# Altium project Microcontroller.PrjPcb
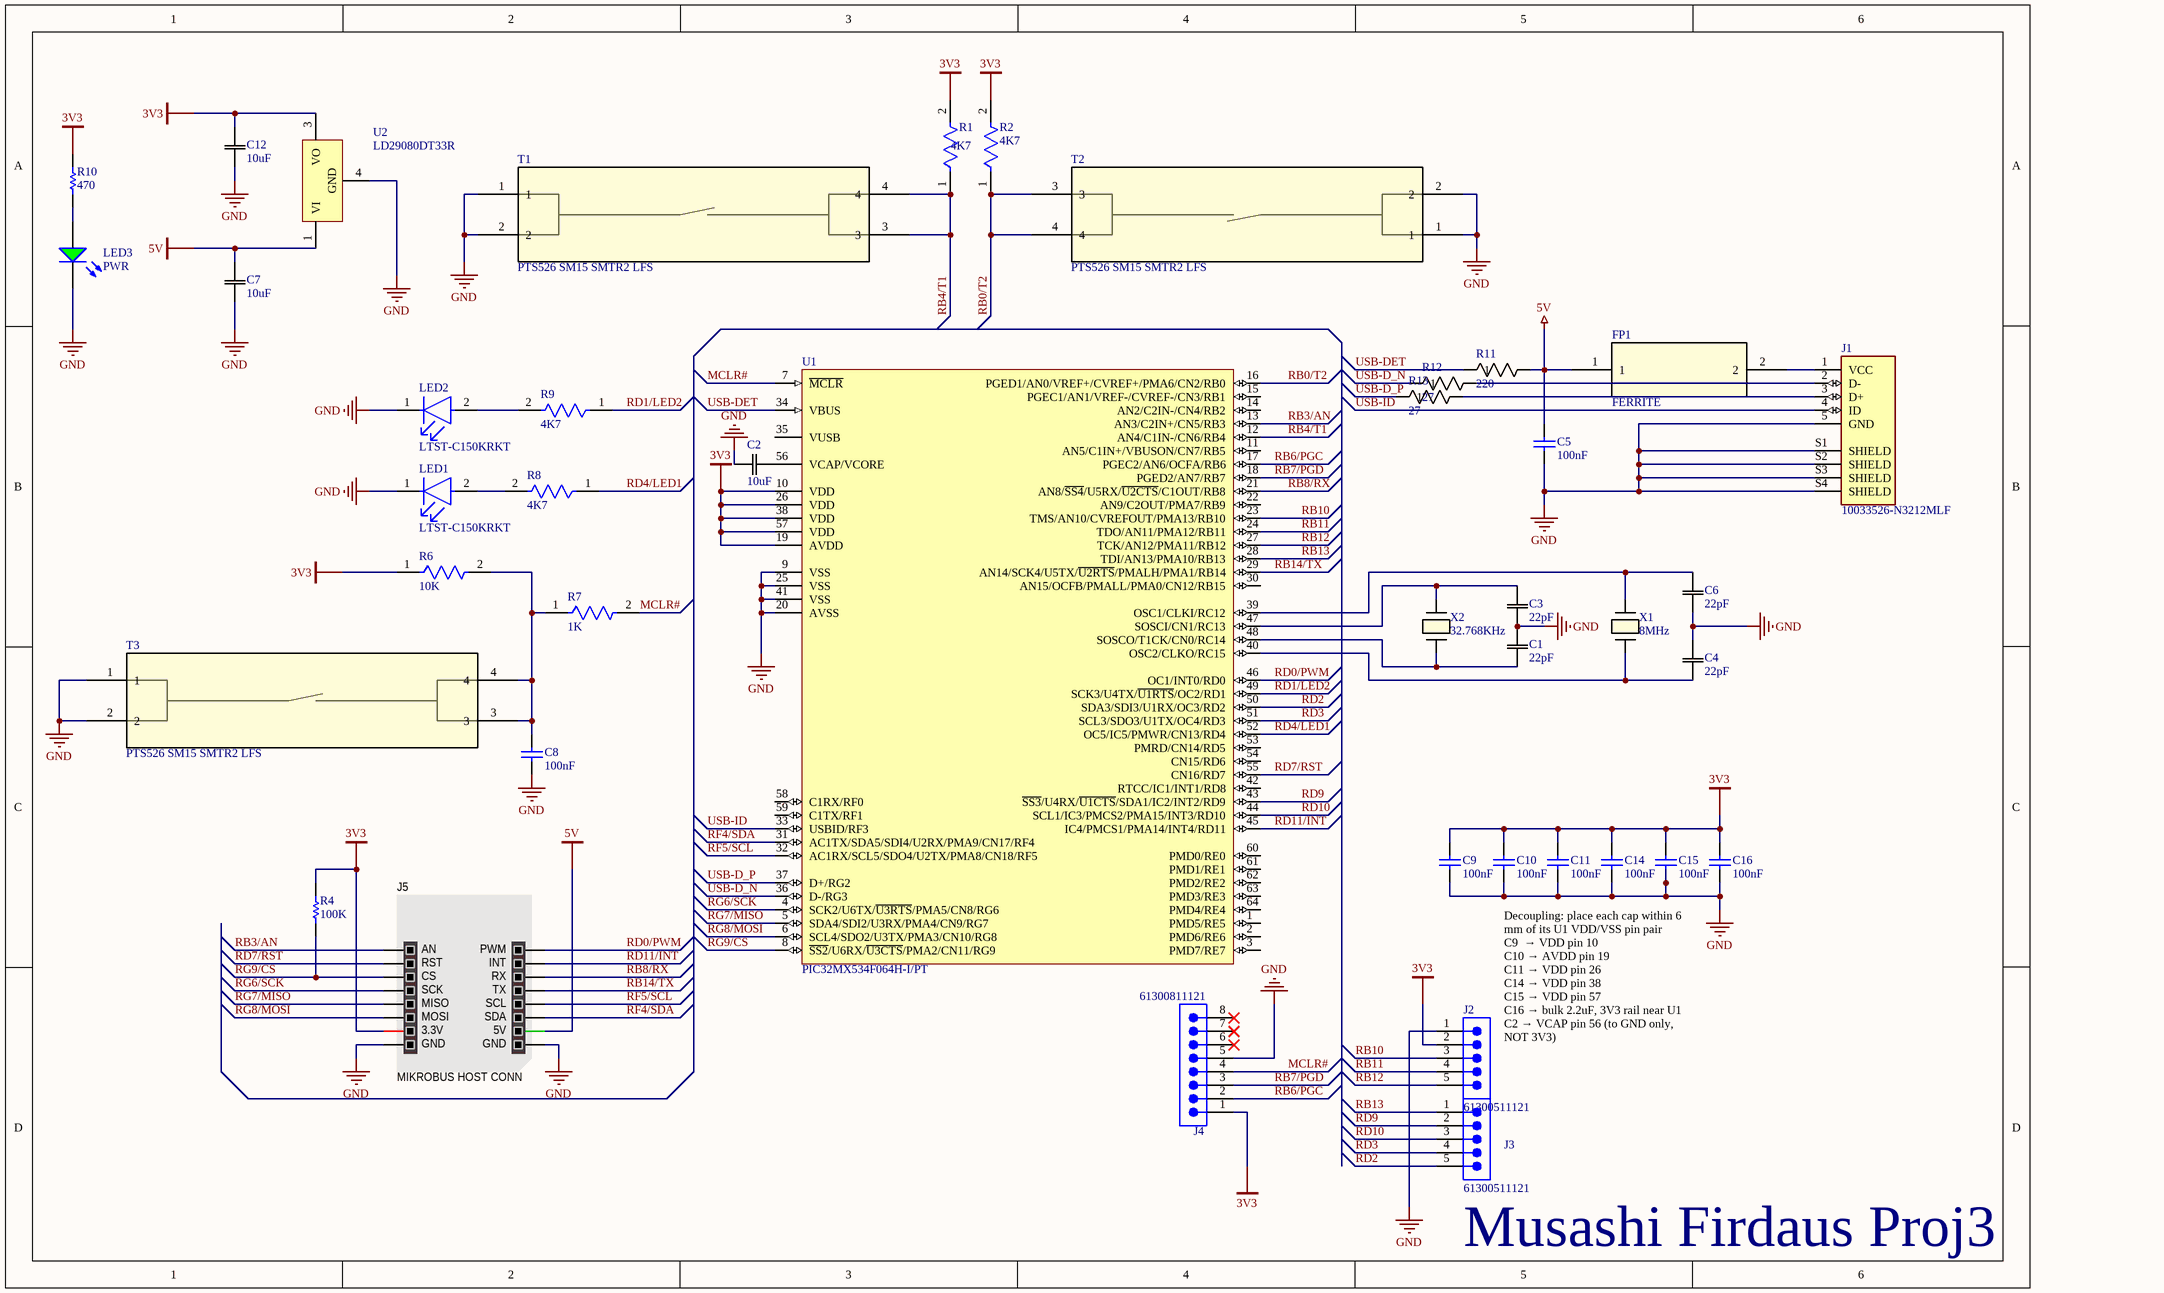
[diagram p0: Microcontroller.SchDoc]
1 sheet, 42 parts. Net scope: global (net labels, ports and power ports of the same name join across sheets).
Board file: Microcontroller.PcbDoc

## Sheet Microcontroller.SchDoc
size 381 x 241 mm; SheetNumber: 1; SheetTotal: 1

### Parts
C1  22pF  [CAP_CL31_SAM]
C2  10uF  [CAP_CL31_SAM]
C3  22pF  [CAP_CL31_SAM]
C4  22pF  [CAP_CL31_SAM]
C5  100nF  [KEMT-1206-2_M]
C6  22pF  [CAP_CL31_SAM]
C7  10uF  [CAP_CL31_SAM]
C8  100nF  [KEMT-1206-2_M]
C9  100nF  [KEMT-1206-2_M]
C10  100nF  [KEMT-1206-2_M]
C11  100nF  [KEMT-1206-2_M]
C12  10uF  [CAP_CL31_SAM]
C14  100nF  [KEMT-1206-2_M]
C15  100nF  [KEMT-1206-2_M]
C16  100nF  [KEMT-1206-2_M]
FP1  FERRITE  [HI1206P121R-10_LRD]
J1  10033526-N3212MLF  [AMPHENOL_10033526-N3212MLF]
J2  61300511121  [61300511121]
J3  61300511121  [61300511121]
J4  61300811121  [61300811121]
J5  MIKROBUS HOST CONN  [MIKROBUS HOST CONN 8gen TH]
LED1  LTST-C150KRKT  [FP-LTST-C150KRKT-MFG]
LED2  LTST-C150KRKT  [FP-LTST-C150KRKT-MFG]
LED3  PWR  [LTST-C230KGKT_V]
R1  4K7  [FP-RMCF1206-IPC_A]
R2  4K7  [FP-RMCF1206-IPC_A]
R4  100K  [RESC3116X65X40ML10T20]
R6  10K  [FP-RMCF1206-IPC_B]
R7  1K  [FP-RNCP1206-MFG]
R8  4K7  [FP-RMCF1206-IPC_A]
R9  4K7  [FP-RMCF1206-IPC_A]
R10  470  [RESC1206(3216)_N]
R11  220  [STA_RMCF1206_STP]
R12  27  [STA_RMCF1206_STP]
R13  27  [STA_RMCF1206_STP]
T1  PTS526 SM15 SMTR2 LFS  [SON4_PTS526 SM15 SMTR2 LFS_CNK]
T2  PTS526 SM15 SMTR2 LFS  [SON4_PTS526 SM15 SMTR2 LFS_CNK]
T3  PTS526 SM15 SMTR2 LFS  [SON4_PTS526 SM15 SMTR2 LFS_CNK]
U1  PIC32MX534F064H-I/PT  [TQFP-PT64_L]
U2  LD29080DT33R  [TO-252_N]
X1  8MHz  [XTAL_FC-135_EPS]
X2  32.768KHz  [XTAL_FC-135_EPS]

### Nets
3V3: C9.1 C10.1 C11.1 C12.2 C14.1 C15.1 C16.1 J2.2 J4.1 J5.7(3.3V) R1.2 R2.2 R4.2 R6.1 R10.2 U1.10(VDD) U1.19(AVDD) U1.26(VDD) U1.38(VDD) U1.57(VDD) U2.3(VO)
5V: C5.2 C7.2 FP1.1 J5.10(5V) R11.2 U2.1(VI)
GND: C1.2 C2.1 C3.1 C4.2 C5.1 C6.1 C7.1 C8.1 C9.2 C10.2 C11.2 C12.1 C14.2 C15.2 C16.2 J1.5(GND) J1.S1(SHIELD) J1.S2(SHIELD) J1.S3(SHIELD) J1.S4(SHIELD) J2.1 J4.5 J5.8(GND) J5.9(GND) LED1.1(C) LED2.1(C) LED3.2(K) T1.1 T1.2 T2.1 T2.2 T3.1 T3.2 U1.9(VSS) U1.20(AVSS) U1.25(VSS) U1.41(VSS) U2.4(GND)
MCLR#: J4.4 R7.2 U1.7(~{MCLR})
RB0/T2: R2.1 T2.3 T2.4 U1.16(PGED1/AN0/VREF+/CVREF+/PMA6/CN2/RB0)
RB3/AN: J5.1(AN) U1.13(AN3/C2IN+/CN5/RB3)
RB4/T1: R1.1 T1.3 T1.4 U1.12(AN4/C1IN-/CN6/RB4)
RB6/PGC: J4.2 U1.17(PGEC2/AN6/OCFA/RB6)
RB7/PGD: J4.3 U1.18(PGED2/AN7/RB7)
RB8/RX: J5.14(RX) U1.21(AN8/~{SS4}/U5RX/~{U2CTS}/C1OUT/RB8)
RB10: J2.3 U1.23(TMS/AN10/CVREFOUT/PMA13/RB10)
RB11: J2.4 U1.24(TDO/AN11/PMA12/RB11)
RB12: J2.5 U1.27(TCK/AN12/PMA11/RB12)
RB13: J3.1 U1.28(TDI/AN13/PMA10/RB13)
RB14/TX: J5.13(TX) U1.29(AN14/SCK4/U5TX/~{U2RTS}/PMALH/PMA1/RB14)
RD0/PWM: J5.16(PWM) U1.46(OC1/INT0/RD0)
RD1/LED2: R9.1 U1.49(SCK3/U4TX/~{U1RTS}/OC2/RD1)
RD2: J3.5 U1.50(SDA3/SDI3/U1RX/OC3/RD2)
RD3: J3.4 U1.51(SCL3/SDO3/U1TX/OC4/RD3)
RD4/LED1: R8.1 U1.52(OC5/IC5/PMWR/CN13/RD4)
RD7/RST: J5.2(RST) U1.55(CN16/RD7)
RD9: J3.2 U1.43(~{SS3}/U4RX/~{U1CTS}/SDA1/IC2/INT2/RD9)
RD10: J3.3 U1.44(SCL1/IC3/PMCS2/PMA15/INT3/RD10)
RD11/INT: J5.15(INT) U1.45(IC4/PMCS1/PMA14/INT4/RD11)
RF4/SDA: J5.11(SDA) U1.31(AC1TX/SDA5/SDI4/U2RX/PMA9/CN17/RF4)
RF5/SCL: J5.12(SCL) U1.32(AC1RX/SCL5/SDO4/U2TX/PMA8/CN18/RF5)
RG6/SCK: J5.4(SCK) U1.4(SCK2/U6TX/~{U3RTS}/PMA5/CN8/RG6)
RG7/MISO: J5.5(MISO) U1.5(SDA4/SDI2/U3RX/PMA4/CN9/RG7)
RG8/MOSI: J5.6(MOSI) U1.6(SCL4/SDO2/U3TX/PMA3/CN10/RG8)
RG9/CS: J5.3(CS) R4.1 U1.8(~{SS2}/U6RX/~{U3CTS}/PMA2/CN11/RG9)
USB-D_N: R12.1 U1.36(D-/RG3)
USB-D_P: R13.1 U1.37(D+/RG2)
USB-DET: R11.1 U1.34(VBUS)
USB-ID: J1.4(ID) U1.33(USBID/RF3)
NetC1_1: C1.1 U1.48(SOSCO/T1CK/CN0/RC14) X2.1
NetC2_2: C2.2 U1.56(VCAP/VCORE)
NetC3_2: C3.2 U1.47(SOSCI/CN1/RC13) X2.2
NetC4_1: C4.1 U1.40(OSC2/CLKO/RC15) X1.1
NetC6_2: C6.2 U1.39(OSC1/CLKI/RC12) X1.2
NetC8_2: C8.2 R6.2 R7.1 T3.3 T3.4
NetFP1_2: FP1.2 J1.1(VCC)
NetJ1_2: J1.2(D-) R12.2
NetJ1_3: J1.3(D+) R13.2
NetLED1_2: LED1.2(A) R8.2
NetLED2_2: LED2.2(A) R9.2
NetLED3_1: LED3.1(A) R10.1

Not connected (* = marked no-connect by the designer): J4 6* 7* 8*; U1 1(PMD5/RE5) 2(PMD6/RE6) 3(PMD7/RE7) 11(AN5/C1IN+/VBUSON/CN7/RB5) 14(AN2/C2IN-/CN4/RB2) 15(PGEC1/AN1/VREF-/CVREF-/CN3/RB1) 22(AN9/C2OUT/PMA7/RB9) 30(AN15/OCFB/PMALL/PMA0/CN12/RB15) 35(VUSB) 42(RTCC/IC1/INT1/RD8) 53(PMRD/CN14/RD5) 54(CN15/RD6) 58(C1RX/RF0) 59(C1TX/RF1) 60(PMD0/RE0) 61(PMD1/RE1) 62(PMD2/RE2) 63(PMD3/RE3) 64(PMD4/RE4)

### Notes on the sheet
- Decoupling: place each cap within 6 mm of its U1 VDD/VSS pin pair
  C9  → VDD pin 10
  C10 → AVDD pin 19
  C11 → VDD pin 26
  C14 → VDD pin 38
  C15 → VDD pin 57
  C16 → bulk 2.2uF, 3V3 rail near U1
  C2 → VCAP pin 56 (to GND only, NOT 3V3)
- (near J3) Musashi Firdaus Proj3

### Library data of the parts
C1 C3 C4 C6 = CL31C220JBCNNNC: Description; Manufacturer_Name: Samsung; Copyright: Copyright (C) 2026 Ultra Librarian. All rights reserved.; Manufacturer_Part_Number: CL31C220JBCNNNC
C2 C7 C12 = CL31B106KAHNNNE: Description; Manufacturer_Name: Samsung; Copyright: Copyright (C) 2025 Ultra Librarian. All rights reserved.; Manufacturer_Part_Number: CL31B106KAHNNNE
C5 C8-C11 C14-C16 = CMP-1037-04202-2: CAP, Ceramic, 0.1 uF, +/- 10%, 50 V, -55 to 125 degC, 1206 (3216 Metric), RoHS, Tape and Reel; Manufacturer: Kemet; Voltage Rating: 50V; Capacitance: 0.1µF; Product Range: KEMET-CSeries; SVHC: ToBeAdvised; Dielectric Characteristic: X7R; Capacitor Case Style: 1206[3216Metric]; Package Reference: 1206-2; Package Description: 2-Leads SMD, Body 3.2 x 1.6 mm; Packaging: Tape&Reel; Operating Temperature Max: 125degC; Capacitance Tolerance: ±10%; Datasheet URL: https://datasheet.ciiva.com/6125/1725438-6125494.pdf; Manufacturer URL: http://www.kemet.com/; Operating Temperature Min: -55degC; Datasheet Version: Jul-13
FP1 = HI1206P121R-10: Description; Manufacturer_Name: Laird; Copyright: Copyright (C) 2025 Ultra Librarian. All rights reserved.; Manufacturer_Part_Number: HI1206P121R-10; RefDes: RefDes; Type: Type
J1 = CMP-002-00071-1: Right Angle Surface Mount Mount Female Type B USB Connector; MF: Amphenol ICC; Source: 10033526-N3212MLF.SchLib; SnapEDA_Link: https://www.snapeda.com/parts/10033526-N3212MLF/Amphenol/view-part/?ref=snap; Pins: 9; Component Type: Standard; Case/Package: None; Check_prices: https://www.snapeda.com/parts/10033526-N3212MLF/Amphenol/view-part/?ref=eda; MP: 10033526-N3212MLF; Design Item ID: 10033526-N3212MLF; Value: *
J2 J3 = CMP-1502-01068-4: THT Vertical Pin Header WR-PHD, Pitch 2.54 mm, Single Row, 5 pins; Number of Contacts: 5; Connector Type: Male Pin; Operating Supply Voltage: 250V; Contact Resistance: 20mΩ; Gender: Male; Pitch: 2.54mm; Current Rating: 3A; Min Operating Temperature: -40°C; Contact Material: Gold; Color: Black; RoHS: Compliant; Number of Rows: 1; Lead Free: Lead Free; Height: 8.89mm; Contact Plating: Gold; Number of Pins: 5; Orientation: Vertical; Voltage Rating: 250V; Packaging: Bulk; Number of Positions: 5; Max Operating Temperature: 105°C; Termination: Solder; Lead Pitch: 2.54mm; Contact Mating Length: 5.9944mm; Mount: Through Hole
J4 = CMP-1502-01076-4: THT Vertical Pin Header WR-PHD, Pitch 2.54 mm, Single Row, 8 pins; Pitch: 2.54mm; Voltage Rating: 250V; Connector Type: Male Pin; Current Rating: 3A; Contact Resistance: 20mΩ; Number of Positions: 8; Gender: Male; Contact Mating Length: 5.9944mm; Orientation: Vertical; Contact Plating: Gold; Mount: Through Hole; Min Operating Temperature: -40°C; Packaging: Bulk; Height: 8.54mm; Number of Pins: 8; Contact Material: Gold; Operating Supply Voltage: 250V; Termination: Solder; RoHS: Compliant; Color: Black; Number of Contacts: 8; Lead Pitch: 2.54mm; Number of Rows: 1; Max Operating Temperature: 105°C
LED1 LED2 = CMP-2000-06617-2: LED RED CLEAR 1206 SMD; Wavelength: 639nm; Power Dissipation: 62.5mW; Luminous Intensity: 54mcd; Test Current: 20mA; Forward Current: 30mA; Reverse Voltage: 5V; Viewing Angle: 130°; Number of Elements: 1; Lens Style: Diffused; Power Rating: 75mW; Lens Color: Colorless; Forward Voltage: 2V; Dominant Wavelength: 631nm; Depth: 1.6mm; Mount: Surface Mount; Packaging: Tape and Reel; Case Code (Metric): 3216; Lens Transparency: Clear; Illumination Color: Red; Radiation Hardening: No; Min Operating Temperature: -30°C; Height: 1.1mm; Case Code (Imperial): 1206; Number of Pins: 2; Length: 3.2mm; Lead Free: Lead Free; Color: Red; Width: 1.6mm; Number of LEDs: 1; Max Operating Temperature: 85°C; Case/Package: 1206; Package Quantity: 1
LED3 = CMP-2000-06625-1: LED Green, 75 mW, 30 mA, -30 to 85 degC, 2-Pin SMD, RoHS, Tape and Reel; Manufacturer: Lite-On; Product Length (mm): 3.2mm; Type: Uni-Color; Peak Wavelength: 574nm; Shape Type: Rectangular; DELETED: Compliant; Lum Intensity: 35mcd; Forward Voltage: 2.4V; High Brightness: Yes; Rad Hardened: No; Power Dissipation: 75W; Forward Current: 30mA; Emitting Color: YellowGreen; Main Category: ChipLED; Product Height (mm): 1.1mm; Product Depth (mm): 1.6mm; Number of  Elements: 1; Viewing Angle: 130deg; Chip Material: AlGaInP; Dominant Wave Length: 571nm; Test Current (It): 20mA; Reverse Voltage: 5V; Mounting: SurfaceMount; Datasheet URL: http://optoelectronics.liteon.com/upload/download/DS22-2000-256/S_110_LTST-C230KGKT.pdf; Luminous Intensity: 35mcd; Pin Count: 2; Mounting Technology: SurfaceMount; Operating Temperature Classification: Industrial; Operating Temp Range: -55Cto85C; Package Type: ChipLed; Manufacturer URL: http://www.us.liteon.com/; Package Description: 2-Pin Surface Mount Device, Body 3.2 x 1.6 mm; Package Reference: C230KGKT; Datasheet Version: Rev. G, 12/2014; Lens Dimensions: 1.5X1.6X0.82mm; Packaging: TapeandReel
R1 R2 R8 R9 = CMP-26527-005426-1: 4.7kΩ ±5% 0.25W 1206 Thick Film Chip Resistor AEC-Q200 compliant; Max Power Dissipation: 250mW; Resistance: 4.7kR; Temperature Coefficient: 200ppm/°C; RoHS Compliant: Yes; Radiation Hardening: No; Resistor Type: Thick Film; Number of Terminations: 2; Mount: Surface Mount; Series: RMCF; Tolerance: 5%; Features: Automotive AEC-Q200; Width: 0.063inch; Case Code (Metric): 3216; Military Standard: Not; Packaging: Tape and Reel; Height: 0.028inch; Size Code: 1206; Lead Free: Lead Free; Max Operating Temperature: 155°C; Length: 3.2mm; Construction: Rectangular; Depth: 1.6mm; Case/Package: 1206; Contact Plating: Tin; Case Code (Imperial): 1206; Power Rating: 250mW; Min Operating Temperature: -55°C
R4 = CMP-2100-03674-1: Chip Resistor, 100 KOhm, +/- 1%, 0.25 W, -55 to 155 degC, 1206 (3216 Metric), RoHS, Tape and Reel; Manufacturer: Yageo; Voltage Rating: 200V; Temperature Coefficient: 100ppm/degreesC; Power Rating: 250mW; Case Code (Metric): 3216; Composition: ThickFilm; Lead Free: LeadFree; Max Operating Temperature: 155degC; Case/Package: 1206; Min Operating Temperature: -55degC; Depth: 1.6mm; RoHSCompliant: true; Datasheet URL: http://www.yageo.com/NewPortal/yageodocoutput?fileName=/pdf/R-Chip/PYu-RC_Group_51_RoHS_L_5.pdf; Datasheet Version: Rev. 5, 10/2016; Package Reference: 1206.0; Packaging: TapeandReel; Resistance: 100KOhm; Manufacturer URL: http://www.yageo.com/; Tolerance: 1%; Height: 0.55mm; REACH SVHC: NoSVHC; Case Code (Imperial): 1206; Length: 3.1mm; Package Description: 2-Pin Surface Mount Device, Body 3.1 x 1.6 mm; Termination: SMD/SMT
R6 = CMP-26527-000151-1: 10kΩ ±1% 0.25W 1206 Thick Film Chip Resistor AEC-Q200 compliant; Resistance: 10kR; Temperature Coefficient: 100ppm/°C; Max Power Dissipation: 250mW; Packaging: Tape and Reel; Resistor Type: Thick Film; Number of Terminations: 2; Depth: 1.6mm; Military Standard: Not; Contact Plating: Tin; Radiation Hardening: No; Lead Free: Lead Free; Tolerance: 1%; Length: 3.2mm; Size Code: 1206; RoHS Compliant: Yes; Case/Package: 1206; Mount: Surface Mount; Features: Automotive AEC-Q200; Min Operating Temperature: -55°C; Series: RMCF; Case Code (Imperial): 1206; Construction: Rectangular; Max Operating Temperature: 155°C; Width: 0.063inch; Height: 0.028inch; Power Rating: 250mW; Case Code (Metric): 3216
R7 = CMP-26527-000033-1: 1kΩ ±1% 0.5W 1206 High Power Anti-Sulfur Thin Film Chip Resistor; Max Power Dissipation: 500mW; Temperature Coefficient: 100ppm/°C; Resistance: 1kR; Packaging: Tape and Reel; Height: 0.024inch; Features: Moisture Resistant; Lead Free: Lead Free; Case Code (Imperial): 1206; Max Operating Temperature: 155°C; Tolerance: 1%; Contact Plating: Tin; Number of Terminations: 2; Length: 0.122inch; Radiation Hardening: No; Case Code (Metric): 3216; RoHS Compliant: Yes; Resistor Type: Thin Film; Mount: Surface Mount; Case/Package: 1206; Min Operating Temperature: -55°C; Series: RNCP; Width: 0.059inch
R10 = CMP-1014-00066-1: 470R 0.25W 5% 1206 (3216 Metric)  SMD; Value: 470.00 Ohm; Case-Metric: 3216; Case-EIA: 1206; Tolerance: 5 %; Power: 0.25 W; Technology: SMT
R11-R13 = RMCF1206FT4K70: Description; Manufacturer_Name: Stackpole International; Copyright: Copyright (C) 2026 Ultra Librarian. All rights reserved.; Manufacturer_Part_Number: RMCF1206FT4K70
T1-T3 = PTS526 SM15 SMTR2 LFS: Description; Manufacturer_Name: C&K Components; Copyright: Copyright (C) 2026 Ultra Librarian. All rights reserved.; Manufacturer_Part_Number: PTS526 SM15 SMTR2 LFS; RefDes: RefDes; Type: Type
U1 = CMP-0048-00357-1: High Performance 80 MHz MIPS-Based 32-Bit Flash Microcontroller with USB and CAN, 64KB Program Memory, 64-pin TQFP, Industrial Temperature; ComponentLink2Description: Packaging Specification; DatasheetVersion: revG, May-2011; ComponentLink1Description: Datasheet; ComponentLink3URL: http://www.microchip.com/; ComponentLink2URL: http://ww1.microchip.com/downloads/en/PackagingSpec/en012702.pdf; PackageDescription: 64-Lead Thin Plastic Quad Flat Pack (PT) - 10x10x1mm Body, 2.00mm [TQFP]; PackageReference: TQFP-PT64; PackageVersion: revBB, Aug-2009; ComponentLink1URL: http://ww1.microchip.com/downloads/en/DeviceDoc/61156G.pdf; ComponentLink3Description: Microchip.com Home; Code_JEDEC: MS-026
U2 = CMP-0244-00114-1: 800mA, Very-Low Drop Voltage Regulator, 3.3V, 3-Pin DPAK; ComponentLink1Description: Manufacturer URL; ComponentLink2URL: http://www.st.com/internet/com/TECHNICAL_RESOURCES/TECHNICAL_LITERATURE/DATASHEET/CD00044919.pdf; PackageReference: TO-252; PackageDescription: 3-Pin Transistor Outline Package 2.28 mm Pitch, 9.7 mm Lead Span (DPAK); PackageVersion: 2011; DatasheetVersion: 22/02/2011; ComponentLink2Description: Datasheet; ComponentLink1URL: http://www.st.com
X1 X2 = FC-135 32.7680KA-A5: Description; Manufacturer_Name: Epson; Copyright: Copyright (C) 2025 Ultra Librarian. All rights reserved.; Manufacturer_Part_Number: FC-135 32.7680KA-A5